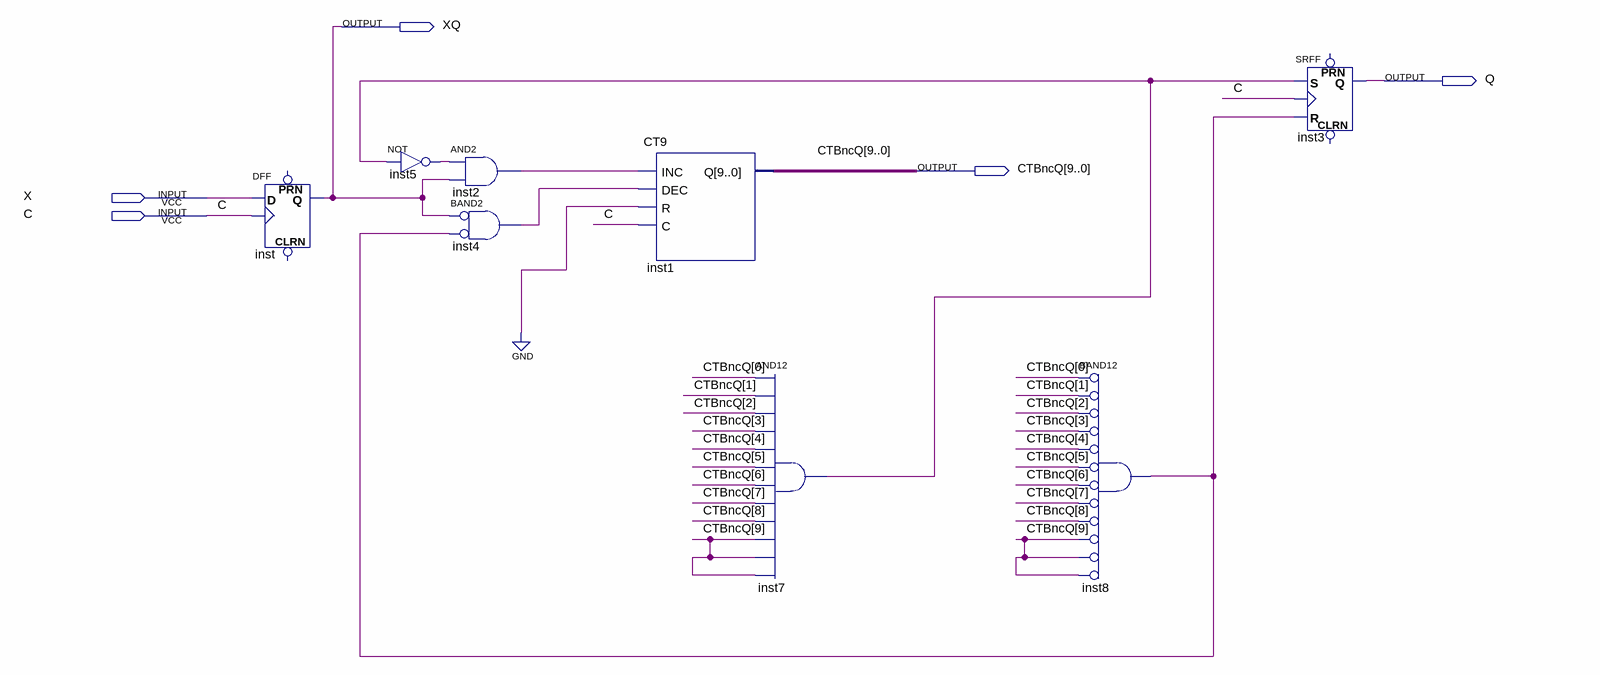
[diagram p0: schematic sheet]
// Quartus schematic Debounce.bdf as structural Verilog: 8 symbols, 5 pins
module Debounce (
  input  X,
  input  C,
  output XQ,
  output Q,
  output [9:0] CTBncQ
);

  wire inst2_out, inst4_out, inst5_out, inst7_out, inst8_out;

  DFF inst (.CLK(C), .D(X), .Q(XQ));  // open: CLRN, PRN
  not inst5 (inst5_out, inst7_out);
  and inst2 (inst2_out, inst5_out, XQ);
  and inst4 (inst4_out, ~XQ, ~inst8_out);  // BAND2
  CT9 inst1 (.INC(inst2_out), .DEC(inst4_out), .R(1'b0), .C(C), .Q(CTBncQ));
  and inst7 (inst7_out, CTBncQ[0], CTBncQ[1], CTBncQ[2], CTBncQ[3], CTBncQ[4], CTBncQ[5], CTBncQ[6], CTBncQ[7], CTBncQ[8], CTBncQ[9], CTBncQ[9], CTBncQ[9]);
  and inst8 (inst8_out, ~CTBncQ[0], ~CTBncQ[1], ~CTBncQ[2], ~CTBncQ[3], ~CTBncQ[4], ~CTBncQ[5], ~CTBncQ[6], ~CTBncQ[7], ~CTBncQ[8], ~CTBncQ[9], ~CTBncQ[9], ~CTBncQ[9]);  // BAND12
  SRFF inst3 (.S(inst7_out), .R(inst8_out), .CLK(C), .Q(Q));  // open: PRN, CLRN
endmodule
